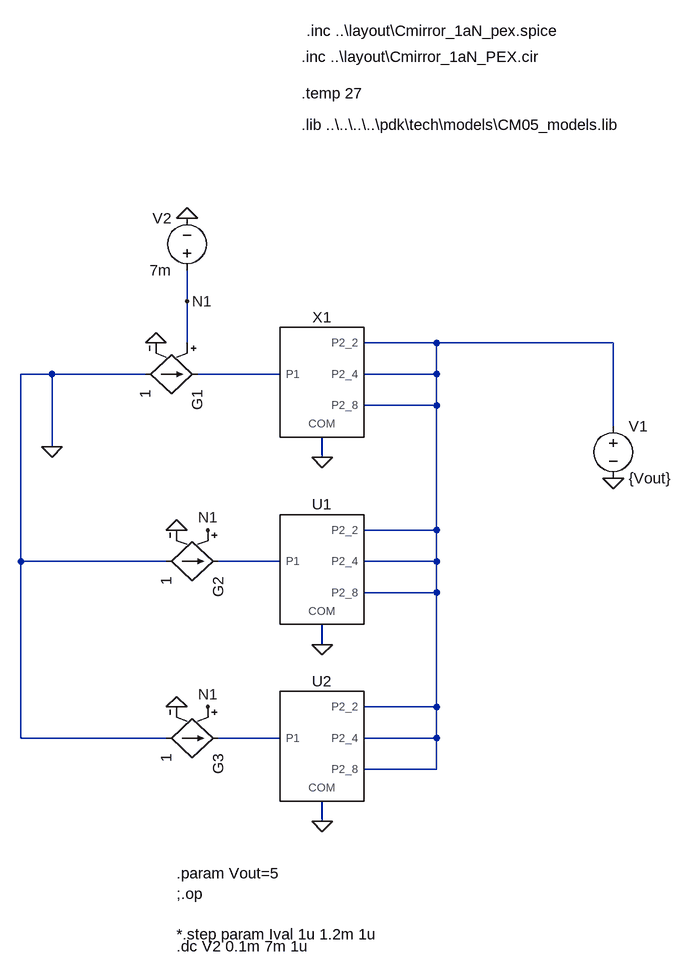
[diagram p0: schematic Cmirror_1aN_tb.asc]
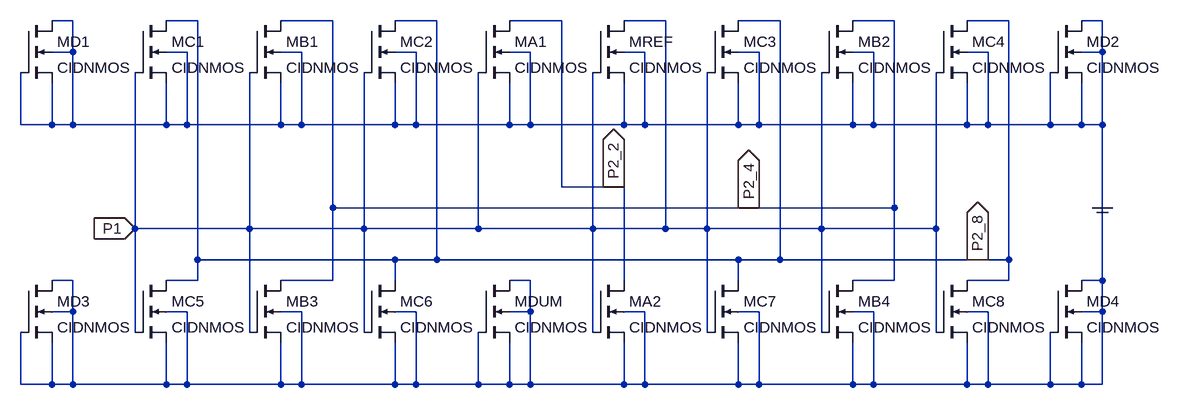
[diagram p1: sub-circuit cmirror_1an_sch.asc]
Cmirror_1aN_tb.asc, the LTspice schematic file:
Version 4.1
SHEET 1 1736 1664
WIRE 32 48 32 0
WIRE 32 112 32 48
WIRE 416 112 304 112
WIRE 688 112 416 112
WIRE -176 160 -224 160
WIRE -32 160 -176 160
WIRE 176 160 48 160
WIRE 416 160 416 112
WIRE 416 160 304 160
WIRE 416 208 416 160
WIRE 416 208 304 208
WIRE 688 240 688 112
WIRE -176 272 -176 160
WIRE 240 288 240 256
WIRE 416 400 416 208
WIRE 416 400 304 400
WIRE -224 448 -224 160
WIRE 0 448 -224 448
WIRE 176 448 80 448
WIRE 416 448 416 400
WIRE 416 448 304 448
WIRE 416 496 416 448
WIRE 416 496 304 496
WIRE 240 576 240 544
WIRE 416 672 416 496
WIRE 416 672 304 672
WIRE -224 720 -224 448
WIRE 0 720 -224 720
WIRE 176 720 80 720
WIRE 416 720 416 672
WIRE 416 720 304 720
WIRE 416 768 416 720
WIRE 416 768 304 768
WIRE 240 848 240 816
FLAG 240 288 0
FLAG 240 576 0
FLAG 240 848 0
FLAG 32 48 N1
FLAG 64 400 N1
FLAG 64 672 N1
FLAG 32 -80 0
FLAG -16 112 0
FLAG 16 400 0
FLAG 16 672 0
FLAG -176 272 0
FLAG 688 320 0
SYMBOL Cmirror_1aN_Lay 240 448 R0
SYMATTR InstName U1
SYMBOL Cmirror_1aN_sch 240 160 R0
SYMATTR InstName X1
SYMBOL g 64 160 R90
SYMATTR InstName G1
SYMATTR Value 1
SYMBOL g 96 448 R90
SYMATTR InstName G2
SYMATTR Value 1
SYMBOL g 96 720 R90
SYMATTR InstName G3
SYMATTR Value 1
SYMBOL voltage 688 224 R0
SYMATTR InstName V1
SYMATTR Value {Vout}
SYMBOL voltage 32 16 R180
WINDOW 0 24 96 Left 2
WINDOW 3 24 16 Left 2
SYMATTR InstName V2
SYMATTR Value 7m
SYMBOL Cmirror_1aN_Pex 240 720 R0
SYMATTR InstName U2
TEXT 208 -224 Left 2 !.lib ..\\..\\..\\..\\pdk\\tech\\models\\CM05_models.lib
TEXT 208 -272 Left 2 !.temp 27
TEXT 208 -328 Left 2 !.inc ..\\layout\\Cmirror_1aN_PEX.cir
TEXT 216 -368 Left 2 !.inc ..\\layout\\Cmirror_1aN_pex.spice
TEXT 16 928 Left 2 !.param Vout=5\n;.op\n \n*.step param Ival 1u 1.2m 1u
TEXT 16 1040 Left 2 !.dc V2 0.1m 7m 1u

cmirror_1an_sch.asc, the sub-circuit schematic file:
Version 4.1
SHEET 1 1276 680
WIRE -1520 32 -1552 32
WIRE -1328 32 -1376 32
WIRE -1120 32 -1200 32
WIRE -960 32 -1024 32
WIRE -768 32 -848 32
WIRE -608 32 -672 32
WIRE -432 32 -496 32
WIRE -256 32 -320 32
WIRE -80 32 -144 32
WIRE 64 32 32 32
WIRE -1520 80 -1520 32
WIRE -1520 80 -1552 80
WIRE -1344 80 -1376 80
WIRE -1168 80 -1200 80
WIRE -992 80 -1024 80
WIRE -816 80 -848 80
WIRE -640 80 -672 80
WIRE -464 80 -496 80
WIRE -288 80 -320 80
WIRE -112 80 -144 80
WIRE 64 80 64 32
WIRE 64 80 32 80
WIRE -1600 192 -1600 112
WIRE -1552 192 -1552 128
WIRE -1552 192 -1600 192
WIRE -1520 192 -1520 80
WIRE -1520 192 -1552 192
WIRE -1376 192 -1376 128
WIRE -1376 192 -1520 192
WIRE -1344 192 -1344 80
WIRE -1344 192 -1376 192
WIRE -1200 192 -1200 128
WIRE -1200 192 -1344 192
WIRE -1168 192 -1168 80
WIRE -1168 192 -1200 192
WIRE -1024 192 -1024 128
WIRE -1024 192 -1168 192
WIRE -992 192 -992 80
WIRE -992 192 -1024 192
WIRE -848 192 -848 128
WIRE -848 192 -992 192
WIRE -816 192 -816 80
WIRE -816 192 -848 192
WIRE -672 192 -672 128
WIRE -672 192 -816 192
WIRE -640 192 -640 80
WIRE -640 192 -672 192
WIRE -496 192 -496 128
WIRE -496 192 -640 192
WIRE -464 192 -464 80
WIRE -464 192 -496 192
WIRE -320 192 -320 128
WIRE -320 192 -464 192
WIRE -288 192 -288 80
WIRE -288 192 -320 192
WIRE -144 192 -144 128
WIRE -144 192 -288 192
WIRE -112 192 -112 80
WIRE -112 192 -144 192
WIRE -16 192 -16 112
WIRE -16 192 -112 192
WIRE 32 192 32 128
WIRE 32 192 -16 192
WIRE 64 192 64 80
WIRE 64 192 32 192
WIRE -768 288 -768 32
WIRE -688 288 -768 288
WIRE -672 288 -688 288
WIRE -1120 320 -1120 32
WIRE -480 320 -1120 320
WIRE -256 320 -256 32
WIRE -256 320 -480 320
WIRE 64 320 64 192
WIRE -1424 352 -1424 112
WIRE -1248 352 -1248 112
WIRE -1248 352 -1424 352
WIRE -1072 352 -1072 112
WIRE -1072 352 -1248 352
WIRE -896 352 -896 112
WIRE -896 352 -1072 352
WIRE -720 352 -720 112
WIRE -720 352 -896 352
WIRE -608 352 -608 32
WIRE -608 352 -720 352
WIRE -544 352 -544 112
WIRE -544 352 -608 352
WIRE -368 352 -368 112
WIRE -368 352 -544 352
WIRE -192 352 -192 112
WIRE -192 352 -368 352
WIRE -1328 400 -1328 32
WIRE -1024 400 -1328 400
WIRE -960 400 -960 32
WIRE -960 400 -1024 400
WIRE -496 400 -960 400
WIRE -432 400 -432 32
WIRE -432 400 -496 400
WIRE -128 400 -432 400
WIRE -80 400 -80 32
WIRE -80 400 -128 400
WIRE -1520 432 -1552 432
WIRE -1328 432 -1328 400
WIRE -1328 432 -1376 432
WIRE -1120 432 -1120 320
WIRE -1120 432 -1200 432
WIRE -1024 432 -1024 400
WIRE -816 432 -848 432
WIRE -672 432 -672 288
WIRE -496 432 -496 400
WIRE -256 432 -256 320
WIRE -256 432 -320 432
WIRE -80 432 -80 400
WIRE -80 432 -144 432
WIRE 64 432 64 320
WIRE 64 432 32 432
WIRE -1520 480 -1520 432
WIRE -1520 480 -1552 480
WIRE -1344 480 -1376 480
WIRE -1168 480 -1200 480
WIRE -992 480 -1024 480
WIRE -816 480 -816 432
WIRE -816 480 -848 480
WIRE -640 480 -672 480
WIRE -464 480 -496 480
WIRE -288 480 -320 480
WIRE -112 480 -144 480
WIRE 64 480 64 432
WIRE 64 480 32 480
WIRE -1424 512 -1424 352
WIRE -1248 512 -1248 352
WIRE -1072 512 -1072 352
WIRE -720 512 -720 352
WIRE -544 512 -544 352
WIRE -368 512 -368 352
WIRE -192 512 -192 352
WIRE -1600 592 -1600 512
WIRE -1552 592 -1552 528
WIRE -1552 592 -1600 592
WIRE -1520 592 -1520 480
WIRE -1520 592 -1552 592
WIRE -1376 592 -1376 528
WIRE -1376 592 -1520 592
WIRE -1344 592 -1344 480
WIRE -1344 592 -1376 592
WIRE -1200 592 -1200 528
WIRE -1200 592 -1344 592
WIRE -1168 592 -1168 480
WIRE -1168 592 -1200 592
WIRE -1024 592 -1024 528
WIRE -1024 592 -1168 592
WIRE -992 592 -992 480
WIRE -992 592 -1024 592
WIRE -896 592 -896 512
WIRE -896 592 -992 592
WIRE -848 592 -848 528
WIRE -848 592 -896 592
WIRE -816 592 -816 480
WIRE -816 592 -848 592
WIRE -672 592 -672 528
WIRE -672 592 -816 592
WIRE -640 592 -640 480
WIRE -640 592 -672 592
WIRE -496 592 -496 528
WIRE -496 592 -640 592
WIRE -464 592 -464 480
WIRE -464 592 -496 592
WIRE -320 592 -320 528
WIRE -320 592 -464 592
WIRE -288 592 -288 480
WIRE -288 592 -320 592
WIRE -144 592 -144 528
WIRE -144 592 -288 592
WIRE -112 592 -112 480
WIRE -112 592 -144 592
WIRE -16 592 -16 512
WIRE -16 592 -112 592
WIRE 32 592 32 528
WIRE 32 592 -16 592
WIRE 64 592 64 480
WIRE 64 592 32 592
FLAG 64 320 COM
IOPIN 64 320 BiDir
FLAG -1424 352 P1
IOPIN -1424 352 In
FLAG -688 288 P2_2
IOPIN -688 288 Out
FLAG -480 320 P2_4
IOPIN -480 320 Out
FLAG -128 400 P2_8
IOPIN -128 400 Out
SYMBOL nmos4 -1600 32 R0
SYMATTR InstName MD1
SYMATTR Value CIDNMOS
SYMATTR Value2 l=10u w=100u
SYMBOL nmos4 -1424 32 R0
SYMATTR InstName MC1
SYMATTR Value CIDNMOS
SYMATTR Value2 l=10u w=100u
SYMBOL nmos4 -1248 32 R0
SYMATTR InstName MB1
SYMATTR Value CIDNMOS
SYMATTR Value2 l=10u w=100u
SYMBOL nmos4 -1072 32 R0
SYMATTR InstName MC2
SYMATTR Value CIDNMOS
SYMATTR Value2 l=10u w=100u
SYMBOL nmos4 -896 32 R0
SYMATTR InstName MA1
SYMATTR Value CIDNMOS
SYMATTR Value2 l=10u w=100u
SYMBOL nmos4 -720 32 R0
SYMATTR InstName MREF
SYMATTR Value CIDNMOS
SYMATTR Value2 l=10u w=100u
SYMBOL nmos4 -544 32 R0
SYMATTR InstName MC3
SYMATTR Value CIDNMOS
SYMATTR Value2 l=10u w=100u
SYMBOL nmos4 -368 32 R0
SYMATTR InstName MB2
SYMATTR Value CIDNMOS
SYMATTR Value2 l=10u w=100u
SYMBOL nmos4 -192 32 R0
SYMATTR InstName MC4
SYMATTR Value CIDNMOS
SYMATTR Value2 l=10u w=100u
SYMBOL nmos4 -16 32 R0
SYMATTR InstName MD2
SYMATTR Value CIDNMOS
SYMATTR Value2 l=10u w=100u
SYMBOL nmos4 -1600 432 R0
SYMATTR InstName MD3
SYMATTR Value CIDNMOS
SYMATTR Value2 l=10u w=100u
SYMBOL nmos4 -1424 432 R0
SYMATTR InstName MC5
SYMATTR Value CIDNMOS
SYMATTR Value2 l=10u w=100u
SYMBOL nmos4 -1248 432 R0
SYMATTR InstName MB3
SYMATTR Value CIDNMOS
SYMATTR Value2 l=10u w=100u
SYMBOL nmos4 -1072 432 R0
SYMATTR InstName MC6
SYMATTR Value CIDNMOS
SYMATTR Value2 l=10u w=100u
SYMBOL nmos4 -896 432 R0
SYMATTR InstName MDUM
SYMATTR Value CIDNMOS
SYMATTR Value2 l=10u w=100u
SYMBOL nmos4 -720 432 R0
SYMATTR InstName MA2
SYMATTR Value CIDNMOS
SYMATTR Value2 l=10u w=100u
SYMBOL nmos4 -544 432 R0
SYMATTR InstName MC7
SYMATTR Value CIDNMOS
SYMATTR Value2 l=10u w=100u
SYMBOL nmos4 -368 432 R0
SYMATTR InstName MB4
SYMATTR Value CIDNMOS
SYMATTR Value2 l=10u w=100u
SYMBOL nmos4 -192 432 R0
SYMATTR InstName MC8
SYMATTR Value CIDNMOS
SYMATTR Value2 l=10u w=100u
SYMBOL nmos4 -16 432 R0
SYMATTR InstName MD4
SYMATTR Value CIDNMOS
SYMATTR Value2 l=10u w=100u

The netlist it stands for:
* Cmirror_1aN_tb.asc
X§U1 N001 N001 N001 N003 0 Cmirror_1aN  ; pins P2_8 P2_2 P2_4 P1 COM
X§X1 N002 N001 N001 N001 0 cmirror_1an_sch
G1 0 N002 N1 0 1
G2 0 N003 N1 0 1
G3 0 N004 N1 0 1
V1 N001 0 {Vout}
V2 N1 0 7m
X§U2 0 N001 N001 N001 N004 Cmirror_1aN_p  ; pins COM P2_8 P2_4 P2_2 P1

* block symbol definitions
.subckt cmirror_1an_sch P1 P2_2 P2_4 P2_8 COM
MD1 COM COM COM COM CIDNMOS l=10u w=100u
MC1 P2_8 P1 COM COM CIDNMOS l=10u w=100u
MB1 P2_4 P1 COM COM CIDNMOS l=10u w=100u
MC2 P2_8 P1 COM COM CIDNMOS l=10u w=100u
MA1 P2_2 P1 COM COM CIDNMOS l=10u w=100u
MREF P1 P1 COM COM CIDNMOS l=10u w=100u
MC3 P2_8 P1 COM COM CIDNMOS l=10u w=100u
MB2 P2_4 P1 COM COM CIDNMOS l=10u w=100u
MC4 P2_8 P1 COM COM CIDNMOS l=10u w=100u
MD2 COM COM COM COM CIDNMOS l=10u w=100u
MD3 COM COM COM COM CIDNMOS l=10u w=100u
MC5 P2_8 P1 COM COM CIDNMOS l=10u w=100u
MB3 P2_4 P1 COM COM CIDNMOS l=10u w=100u
MC6 P2_8 P1 COM COM CIDNMOS l=10u w=100u
MDUM COM COM COM COM CIDNMOS l=10u w=100u
MA2 P2_2 P1 COM COM CIDNMOS l=10u w=100u
MC7 P2_8 P1 COM COM CIDNMOS l=10u w=100u
MB4 P2_4 P1 COM COM CIDNMOS l=10u w=100u
MC8 P2_8 P1 COM COM CIDNMOS l=10u w=100u
MD4 COM COM COM COM CIDNMOS l=10u w=100u
.ends cmirror_1an_sch

.model NMOS NMOS
.model PMOS PMOS
.lib standard.mos
.lib ..\..\..\..\pdk\tech\models\CM05_models.lib
.temp 27
.inc ..\layout\Cmirror_1aN_PEX.cir
.inc ..\layout\Cmirror_1aN_pex.spice
.param Vout=5
;.op
*.step param Ival 1u 1.2m 1u
.dc V2 0.1m 7m 1u
.backanno
.end